# EasyEDA Pro project lovelessing-d133-mobile-phone-development-bo-91bf7213.epro, board PCB2
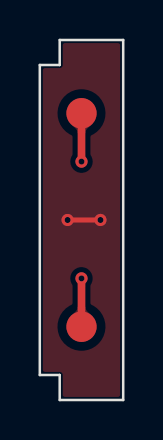
[diagram p9: board, top side]
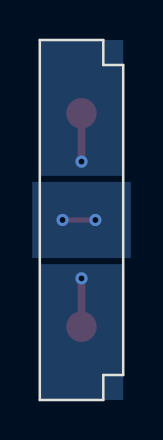
[diagram p10: board, bottom side, seen from below]

Outline 4.19 x 18 mm; copper layers: Top Layer, Bottom Layer. Coordinates in mm from the lower left corner of the outline.
Outline path: 0,1.25 0,16.75 1,16.75 1,18 4.19,18 4.19,0 1,0 1,1.25 0,1.25
Stack: Top Layer 0.035mm / Dielectric1 0.91mm FR4 er 4.5 / Bottom Layer 0.035mm

## Design rules (mm)
spacing copperThickness1oz (default): track to track 0.102, other pairs 0.152 to 0.3
spacing copperThickness2oz: track to track 0.203, other pairs 0.152 to 0.3
spacing Plane_innerPlane: track to track 0.102, other pairs 0.152 to 0.3
spacing Copper_copperRegion: track to track 0.102, other pairs 0.152 to 0.3
track width copperThickness1oz (default): min 0.127, default 0.254, max 2.54
track width copperThickness2oz: min 0.203, default 0.254, max 2.54
differential pair differentialPair (default): width min 0.127, default 0.254, max 2.54; gap min 0.152, default 0.152
pour e21 uses Copper_copperRegion

## Placement (name value [footprint] x y rotation side)
NOREF  -  [Pad_e5]  2.1 14.33 0 top
NOREF#2  -  [Pad_e6]  2.1 3.66 0 top

## Footprints (pads in the part's own frame, mm; a bottom-side part is the same pattern mirrored in y, then rotated)
Pad_e5
  round 1.524 smd: 1(0,0)
Pad_e6
  round 1.524 smd: 1(0,0)

## Nets
As in the schematic.

## Via types
v1: diameter 0.61, hole 0.305, Top Layer to Bottom Layer, 4 vias

## Routing (per net, layer and track width the routed paths; a pad name or vN(x,y) marks a point on that pad's centre or on a via; arc(x,y) is an arc through that point)
GND: length 1.7
  Top Layer w0.254: v1(1.4,9) 3.05,9
  vias: v1(3.05,9)
KEY1: length 2.4
  Top Layer w0.381: NOREF.1 v1(2.1,11.92)
KEY2: length 2.4
  Top Layer w0.381: NOREF#2.1 v1(2.1,6.08)

## Copper pours and planes (outline as drawn; the poured copper is in the pictures)
GND on Top Layer: -0.51,18.4 4.57,18.4 4.57,-0.91 -0.51,-0.91
GND on Bottom Layer: -0.38,10.91 4.57,10.91 4.57,7.1 -0.38,7.1
KEY1 on Bottom Layer: 0,18 4.19,18 4.19,11.21 0,11.21
KEY2 on Bottom Layer: 0,6.79 4.19,6.79 4.19,0 0,0

Small or netless copper shapes (teardrops, artwork), in the pictures only: 4 on Top Layer
